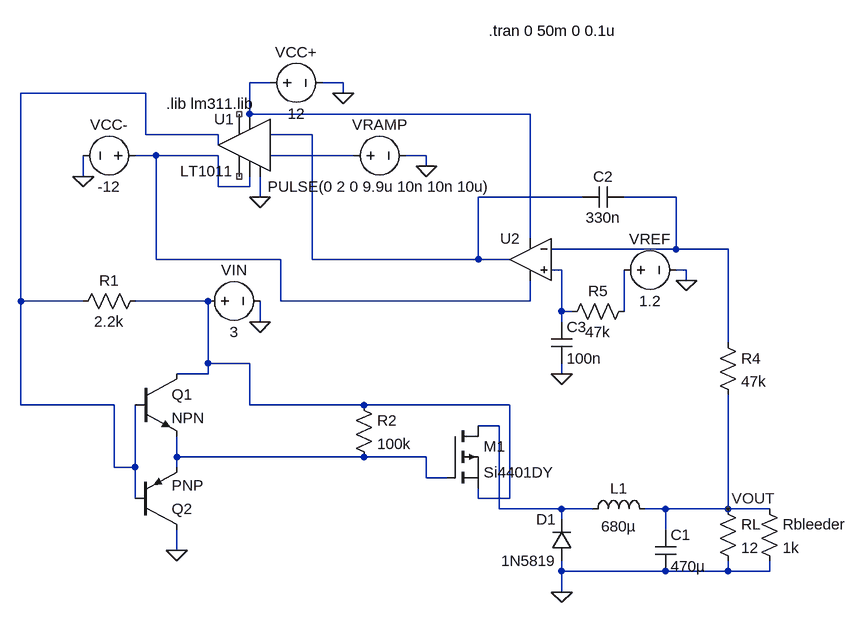
[diagram p0: schematic buck_converter.asc]
buck_converter.asc, the LTspice schematic file:
Version 4.1
SHEET 1 1896 888
WIRE 128 -32 96 -32
WIRE 240 -32 208 -32
WIRE -64 -16 -256 -16
WIRE 240 -16 240 -32
WIRE 96 16 96 -32
WIRE 528 16 96 16
WIRE -64 48 -64 -16
WIRE 48 48 -64 48
WIRE 192 48 128 48
WIRE 48 64 48 48
WIRE -48 80 -80 80
WIRE 48 80 -48 80
WIRE 256 80 128 80
WIRE 368 80 336 80
WIRE 368 96 368 80
WIRE -160 112 -160 80
WIRE 48 128 48 80
WIRE 96 128 96 112
WIRE 96 128 48 128
WIRE 112 144 112 112
WIRE 608 144 448 144
WIRE 752 144 672 144
WIRE 528 208 528 16
WIRE 752 224 752 144
WIRE 752 224 560 224
WIRE 832 224 752 224
WIRE -48 240 -48 80
WIRE 144 240 -48 240
WIRE 192 240 192 48
WIRE 448 240 448 144
WIRE 448 240 192 240
WIRE 496 240 448 240
WIRE 576 256 560 256
WIRE 768 256 752 256
WIRE 768 272 768 256
WIRE -256 304 -256 -16
WIRE -160 304 -256 304
WIRE 32 304 -80 304
WIRE 144 304 144 240
WIRE 528 304 528 272
WIRE 528 304 144 304
WIRE 576 320 576 256
WIRE 592 320 576 320
WIRE 672 320 672 256
WIRE 112 336 112 304
WIRE 576 336 576 320
WIRE 832 368 832 224
WIRE 32 400 32 304
WIRE 96 400 32 400
WIRE 32 416 32 400
WIRE 32 416 -16 416
WIRE 576 416 576 400
WIRE -256 464 -256 304
WIRE -112 464 -256 464
WIRE 96 464 96 400
WIRE 272 464 96 464
WIRE 496 464 272 464
WIRE 480 496 448 496
WIRE -16 544 -16 512
WIRE 272 544 -16 544
WIRE 368 544 272 544
WIRE -112 560 -112 464
WIRE -80 560 -80 464
WIRE -80 560 -112 560
WIRE -16 560 -16 544
WIRE 368 576 368 544
WIRE 400 576 368 576
WIRE -80 608 -80 560
WIRE 448 608 448 592
WIRE 496 608 496 464
WIRE 496 608 448 608
WIRE 480 624 480 496
WIRE 576 624 480 624
WIRE 624 624 576 624
WIRE 736 624 704 624
WIRE 832 624 832 448
WIRE 832 624 736 624
WIRE 896 624 832 624
WIRE 576 640 576 624
WIRE 736 656 736 624
WIRE -16 688 -16 656
WIRE 576 720 576 704
WIRE 736 720 576 720
WIRE 832 720 832 704
WIRE 832 720 736 720
WIRE 896 720 896 704
WIRE 896 720 832 720
WIRE 576 752 576 720
FLAG 240 -16 0
FLAG -160 112 0
FLAG 112 144 0
FLAG 112 336 0
FLAG -16 688 0
FLAG 368 96 0
FLAG 576 752 0
FLAG 768 272 0
FLAG 832 624 VOUT
FLAG 576 416 0
SYMBOL voltage 240 80 R270
WINDOW 0 32 56 VTop 2
WINDOW 3 -32 56 VBottom 2
WINDOW 123 0 0 Left 0
WINDOW 39 0 0 Left 0
SYMATTR InstName VRAMP
SYMATTR Value PULSE(0 2 0 9.9u 10n 10n 10u)
SYMBOL voltage 112 -32 R270
WINDOW 0 32 56 VTop 2
WINDOW 3 -32 56 VBottom 2
SYMATTR InstName VCC+
SYMATTR Value 12
SYMBOL voltage -64 80 R90
WINDOW 0 -32 56 VBottom 2
WINDOW 3 32 56 VTop 2
SYMATTR InstName VCC-
SYMATTR Value -12
SYMBOL npn -80 416 R0
SYMATTR InstName Q1
SYMBOL pnp -80 656 M180
SYMATTR InstName Q2
SYMBOL voltage 16 304 R270
WINDOW 0 32 56 VTop 2
WINDOW 3 -32 56 VBottom 2
WINDOW 123 0 0 Left 0
WINDOW 39 0 0 Left 0
SYMATTR InstName VIN
SYMATTR Value 3
SYMBOL res 256 448 R0
SYMATTR InstName R2
SYMATTR Value 100k
SYMBOL res -64 288 R90
WINDOW 0 0 56 VBottom 2
WINDOW 3 32 56 VTop 2
SYMATTR InstName R1
SYMATTR Value 2.2k
SYMBOL ind 608 640 R270
WINDOW 0 32 56 VTop 2
WINDOW 3 5 56 VBottom 2
SYMATTR InstName L1
SYMATTR Value 680µ
SYMATTR SpiceLine Rser=1m
SYMBOL cap 720 656 R0
SYMATTR InstName C1
SYMATTR Value 470µ
SYMBOL res 816 608 R0
SYMATTR InstName RL
SYMATTR Value 12
SYMBOL diode 592 704 R180
WINDOW 0 24 64 Left 2
WINDOW 3 24 0 Left 2
SYMATTR InstName D1
SYMATTR Value 1N5819
SYMBOL pmos 400 496 R0
SYMATTR InstName M1
SYMATTR Value Si4401DY
SYMBOL res 816 352 R0
SYMATTR InstName R4
SYMATTR Value 47k
SYMBOL cap 672 128 R90
WINDOW 0 0 32 VBottom 2
WINDOW 3 32 32 VTop 2
SYMATTR InstName C2
SYMATTR Value 330n
SYMBOL voltage 656 256 R270
WINDOW 0 32 56 VTop 2
WINDOW 3 -32 56 VBottom 2
SYMATTR InstName VREF
SYMATTR Value 1.2
SYMBOL res 688 304 R90
WINDOW 0 0 56 VBottom 2
WINDOW 3 32 56 VTop 2
SYMATTR InstName R5
SYMATTR Value 47k
SYMBOL cap 560 336 R0
SYMATTR InstName C3
SYMATTR Value 100n
SYMBOL OpAmps\\UniversalOpAmp 528 240 M0
SYMATTR InstName U2
SYMBOL Comparators\\LT1011 96 64 M0
SYMATTR InstName U1
SYMBOL res 880 608 R0
SYMATTR InstName Rbleeder
SYMATTR Value 1k
TEXT -32 0 Left 2 !.lib lm311.lib
TEXT 464 -112 Left 2 !.tran 0 50m 0 0.1u

The netlist it stands for:
* buck_converter.asc
VRAMP N005 0 PULSE(0 2 0 9.9u 10n 10n 10u)
VCC+ N001 0 12
VCC- N004 0 -12
Q1 N008 N002 N011 0 NPN
Q2 0 N002 N011 0 PNP
VIN N008 0 3
R2 N008 N011 100k
R1 N008 N002 2.2k
L1 N010 VOUT 680µ Rser=1m
C1 VOUT 0 470µ
RL VOUT 0 12
D1 0 N010 1N5819
M1 N010 N011 N008 N008 Si4401DY
R4 N006 VOUT 47k
C2 N006 N003 330n
VREF N009 0 1.2
R5 N009 N007 47k
C3 N007 0 100n
X§U2 N007 N006 N001 N004 N003 level1 Avol=1Meg GBW=10Meg Vos=0 En=0 Enk=0 In=0 Ink=0 Rin=500Meg  ; pins In+ In- V+ V- OUT
X§U1 0 N005 N003 N004 NC_01 NC_02 N002 N001 LT1011
Rbleeder VOUT 0 1k
.model D D
.lib standard.dio
.model NPN NPN
.model PNP PNP
.lib standard.bjt
.model NMOS NMOS
.model PMOS PMOS
.lib standard.mos
.lib lm311.lib
.tran 0 50m 0 0.1u
.lib UniversalOpAmp1.lib
.lib LTC1.lib
.backanno
.end